# Altium schematic sheet RF.SchDoc
size A4; SheetNumber: 4; SheetTotal: 4
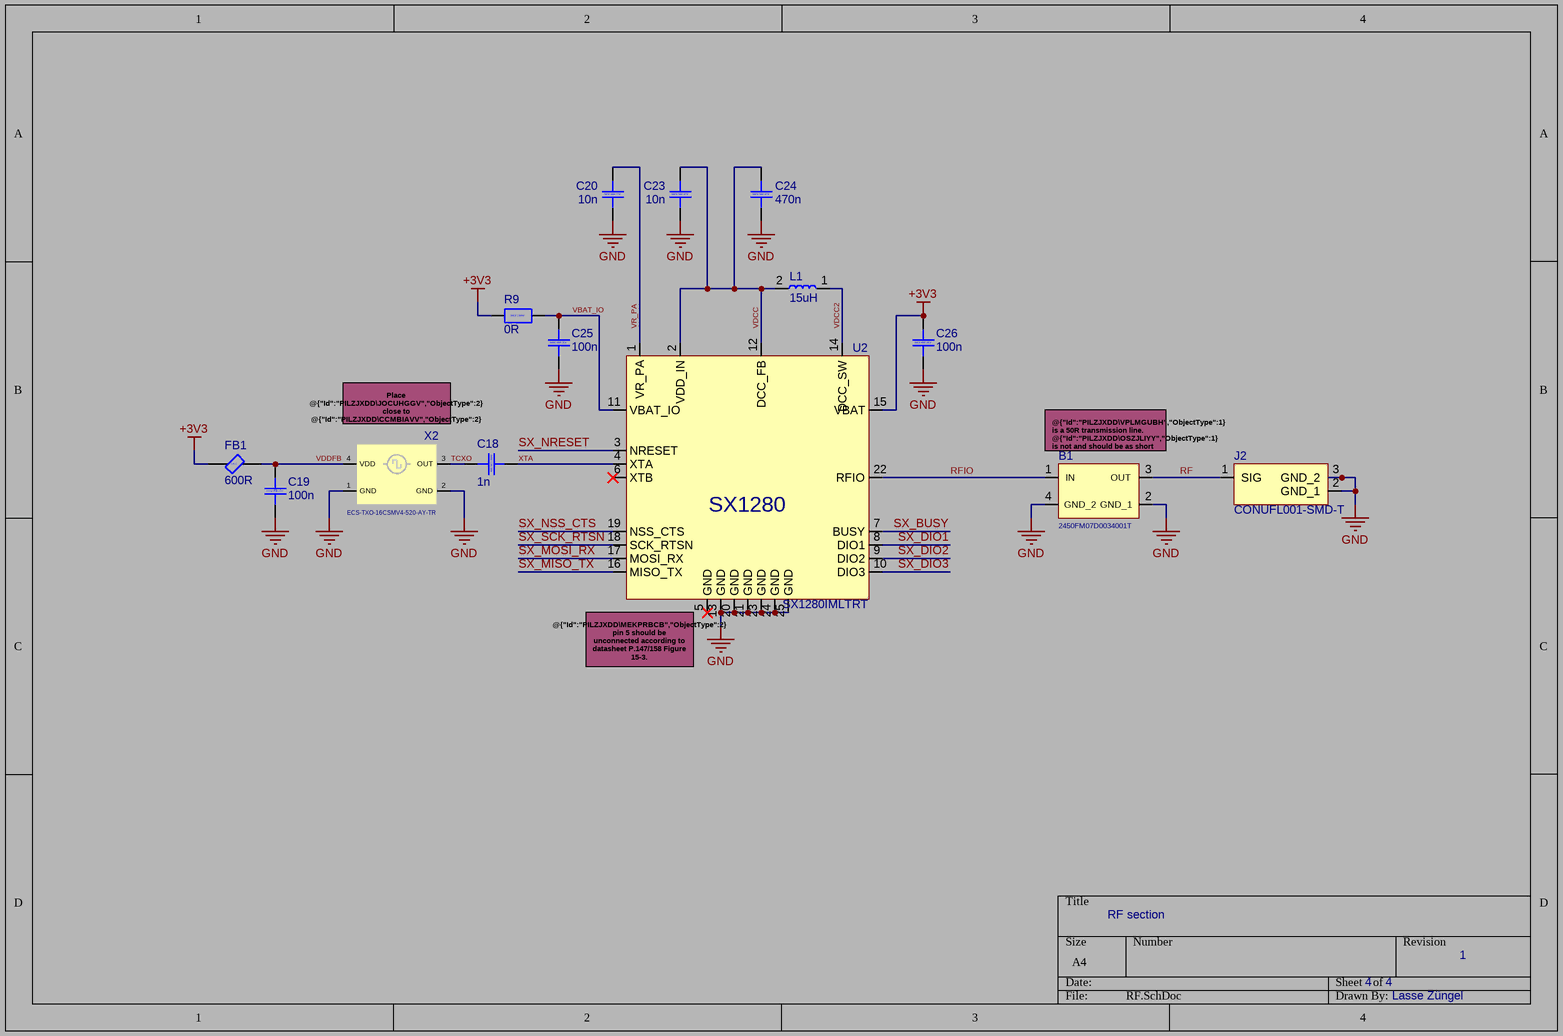
[diagram p0: RF.SchDoc]

## Parts
B1  2450FM07D0034001T  [2450FM07D0034001T]
C18  1n  [CAP_0402]
C19  100n  [CAP_0402]
C20  10n  [CAP_0402]
C23  10n  [CAP_0402]
C24  470n  [CAP_0402]
C25  100n  [CAP_0402]
C26  100n  [CAP_0402]
FB1  600R  [FB_0402]
J2  CONUFL001-SMD-T  [CONUFL001SMDT]
L1  15uH  [INDUCTOR_0805]
R9  0R  [RES_0402]
U2  SX1280IMLTRT  [SX1280IMLTRT]
X2  ECS-TXO-16CSMV4-520-AY-TR  [ECS-TXO-16CSMV4-520-AY-TR]

## Nets
+3V3: C26.2 FB1.1 R9.1 U2.15(VBAT)
GND: B1.2(GND_1) B1.4(GND_2) C19.1 C20.1 C23.1 C24.1 C25.1 C26.1 J2.2(GND_1) J2.3(GND_2) U2.13(GND) U2.20(GND) U2.21(GND) U2.23(GND) U2.24(GND) U2.25(GND) X2.1(GND) X2.2(GND)
RF: B1.3(OUT) J2.1(SIG)
RFIO: B1.1(IN) U2.22(RFIO)
SX_BUSY: U2.7(BUSY)
SX_DIO1: U2.8(DIO1)
SX_DIO2: U2.9(DIO2)
SX_DIO3: U2.10(DIO3)
SX_MISO_TX: U2.16(MISO_TX)
SX_MOSI_RX: U2.17(MOSI_RX)
SX_NRESET: U2.3(NRESET)
SX_NSS_CTS: U2.19(NSS_CTS)
SX_SCK_RTSN: U2.18(SCK_RTSN)
TCXO: C18.1 X2.3(OUT)
VBAT_IO: C25.2 R9.2 U2.11(VBAT_IO)
VDCC: C23.2 C24.2 L1.2 U2.2(VDD_IN) U2.12(DCC_FB)
VDCC2: L1.1 U2.14(DCC_SW)
VDDFB: C19.2 FB1.2 X2.4(VDD)
VR_PA: C20.2 U2.1(VR_PA)
XTA: C18.2 U2.4(XTA)

Not connected (* = marked no-connect by the designer): U2 5(GND)* 6(XTB)*

## Notes on the sheet
- Place @{"Id":"PILZJXDD\JOCUHGGV","ObjectType":2} close to @{"Id":"PILZJXDD\CCMBIAVV","ObjectType":2} and keep @{"Id":"PILZJXDD\STLIQMNA","ObjectType":1}-@{"Id":"PILZJXDD\JOCUHGGV","ObjectType":2}-@{"Id":"PILZJXDD\QAPVDKUX","ObjectType":1} path short.
- (near B1) @{"Id":"PILZJXDD\VPLMGUBH","ObjectType":1} is a 50R transmission line.
  @{"Id":"PILZJXDD\OSZJLIYY","ObjectType":1} is not and should be as short as possible.
- (near U2) @{"Id":"PILZJXDD\MEKPRBCB","ObjectType":2} pin 5 should be unconnected according to datasheet P.147/158 Figure 15-3.
- RF section
- 4    4
- 1
- Lasse Züngel
- (in symbol CAP_0402_C0G_50V) 0402 C0G 50V
- (in symbol CAP_0402_X5R_25V) 0402 X5R 25V
- (in symbol FB_0402) 0402
- (in symbol RES_0402) 0402 1/16W
- (in symbol SX1280IMLTRT) SX1280

## Library data of the parts
B1 = 2450FM07D0034001T: 2.45GHz Impedance Matched Low Pass Filter Optimized for Semtech SX1280 and SX1281 chipsets; Manufacturer_Name: JOHANSON TECHNOLOGY; Geometry.Height: 0.4mm; Mouser Part Number: 609-2450FM07D0034001; Mouser Price/Stock: https://www.mouser.co.uk/ProductDetail/Johanson-Technology/2450FM07D0034001T?qs=jRuttqqUwMRfALoCk7O%252Bzw%3D%3D; Manufacturer_Part_Number: 2450FM07D0034001T; Datasheet Link: https://www.digikey.com/en/products/detail/johanson-technology-inc/2450FM07D0034001T/9477815
C18 = CAP_0402_C0G_50V: Capacitor 0402 generic, C0G (NP0), 50V
C19 C20 C23-C26 = CAP_0402_X5R_25V: Capacitor 0402 generic, X5R, 25V
FB1 = FB_0402: Ferrite bead 0402 generic; MPN: BLM15AG601SN1D
J2 = CONUFL001-SMD-T: RF Connectors / Coaxial Connectors T&R U.FL Straight Surface Mount Jack; Manufacturer_Name: TE Connectivity; Geometry.Height: 1.3mm; Mouser Part Number: N/A; Mouser Price/Stock: https://www.mouser.co.uk/ProductDetail/TE-Connectivity/CONUFL001-SMD-T?qs=3Rah4i%252BhyCHmRzMH%252BkLkPQ%3D%3D; Manufacturer_Part_Number: CONUFL001-SMD-T; Datasheet Link: *
L1 = MLZ2012M150WT000: Power Inductors - SMD 15 UH 20% shielded 250mA; Manufacturer_Name: TDK; Datasheet Link: https://product.tdk.com/system/files/dam/doc/product/inductor/inductor/smd/catalog/inductor_commercial_decoupling_mlz2012_en.pdf; Height: 1.25mm; Manufacturer_Part_Number: MLZ2012M150WT000; Mouser Part Number: 810-MLZ2012M150WT000; Mouser Price/Stock: https://www.mouser.co.uk/ProductDetail/Murata-Electronics/LQW15AN2N2G80D?qs=QzBtWTOodeXwqmhCVrS0ZQ%3D%3D; Arrow Part Number: LQW15AN2N2G80D; Arrow Price/Stock: https://www.arrow.com/en/products/lqw15an2n2g80d/murata-manufacturing
R9 = RES_0402: Resistor 0402 generic, 1/16W
U2 = SX1280IMLTRT: RF Transceiver Long range 2.4 GHz Wireless Transceiver
X2 = ECS-TXO-16CSMV4-520-AY-TR: TCXO Oscillators 52.000 MHz MultiVolt TCXO Clipped Sine Wave 1.7 - 3.6 0.5 ppm -30 - +85C 1.6 x 1.2 mm 4 Pad SM; M: ECS; MPN: ECS-TXO-16CSMV4-520-AY-TR